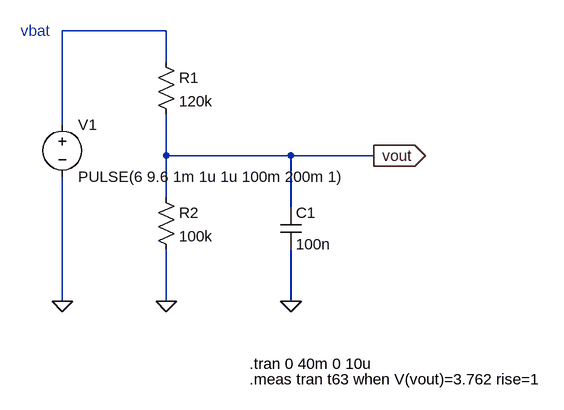
[diagram p0: schematic 04_tran.asc]
04_tran.asc, the LTspice schematic file:
Version 4.1
SHEET 1 968 680
WIRE 336 -80 176 -80
WIRE 336 -32 336 -80
WIRE 176 64 176 -80
WIRE 336 112 336 48
WIRE 528 112 336 112
WIRE 656 112 528 112
WIRE 336 176 336 112
WIRE 528 192 528 112
WIRE 176 336 176 144
WIRE 336 336 336 256
WIRE 528 336 528 256
FLAG 336 336 0
FLAG 176 336 0
FLAG 528 336 0
FLAG 656 112 vout
IOPIN 656 112 Out
SYMBOL voltage 176 48 R0
WINDOW 123 0 0 Left 0
WINDOW 39 0 0 Left 0
SYMATTR InstName V1
SYMATTR Value PULSE(6 9.6 1m 1u 1u 100m 200m 1)
SYMBOL res 320 -48 R0
SYMATTR InstName R1
SYMATTR Value 120k
SYMBOL res 320 160 R0
SYMATTR InstName R2
SYMATTR Value 100k
SYMBOL cap 512 192 R0
SYMATTR InstName C1
SYMATTR Value 100n
TEXT 112 -80 Left 2 ;vbat
TEXT 464 432 Left 2 !.tran 0 40m 0 10u
TEXT 464 456 Left 2 !.meas tran t63 when V(vout)=3.762 rise=1

The netlist it stands for:
* 04_tran.asc
V1 N001 0 PULSE(6 9.6 1m 1u 1u 100m 200m 1)
R1 N001 vout 120k
R2 vout 0 100k
C1 vout 0 100n
* vbat
.tran 0 40m 0 10u
.meas tran t63 when V(vout)=3.762 rise=1
.backanno
.end